# Altium schematic sheet Keyboard_V0.1.SchDoc
size A3; SheetNumber: 1; SheetTotal: 2
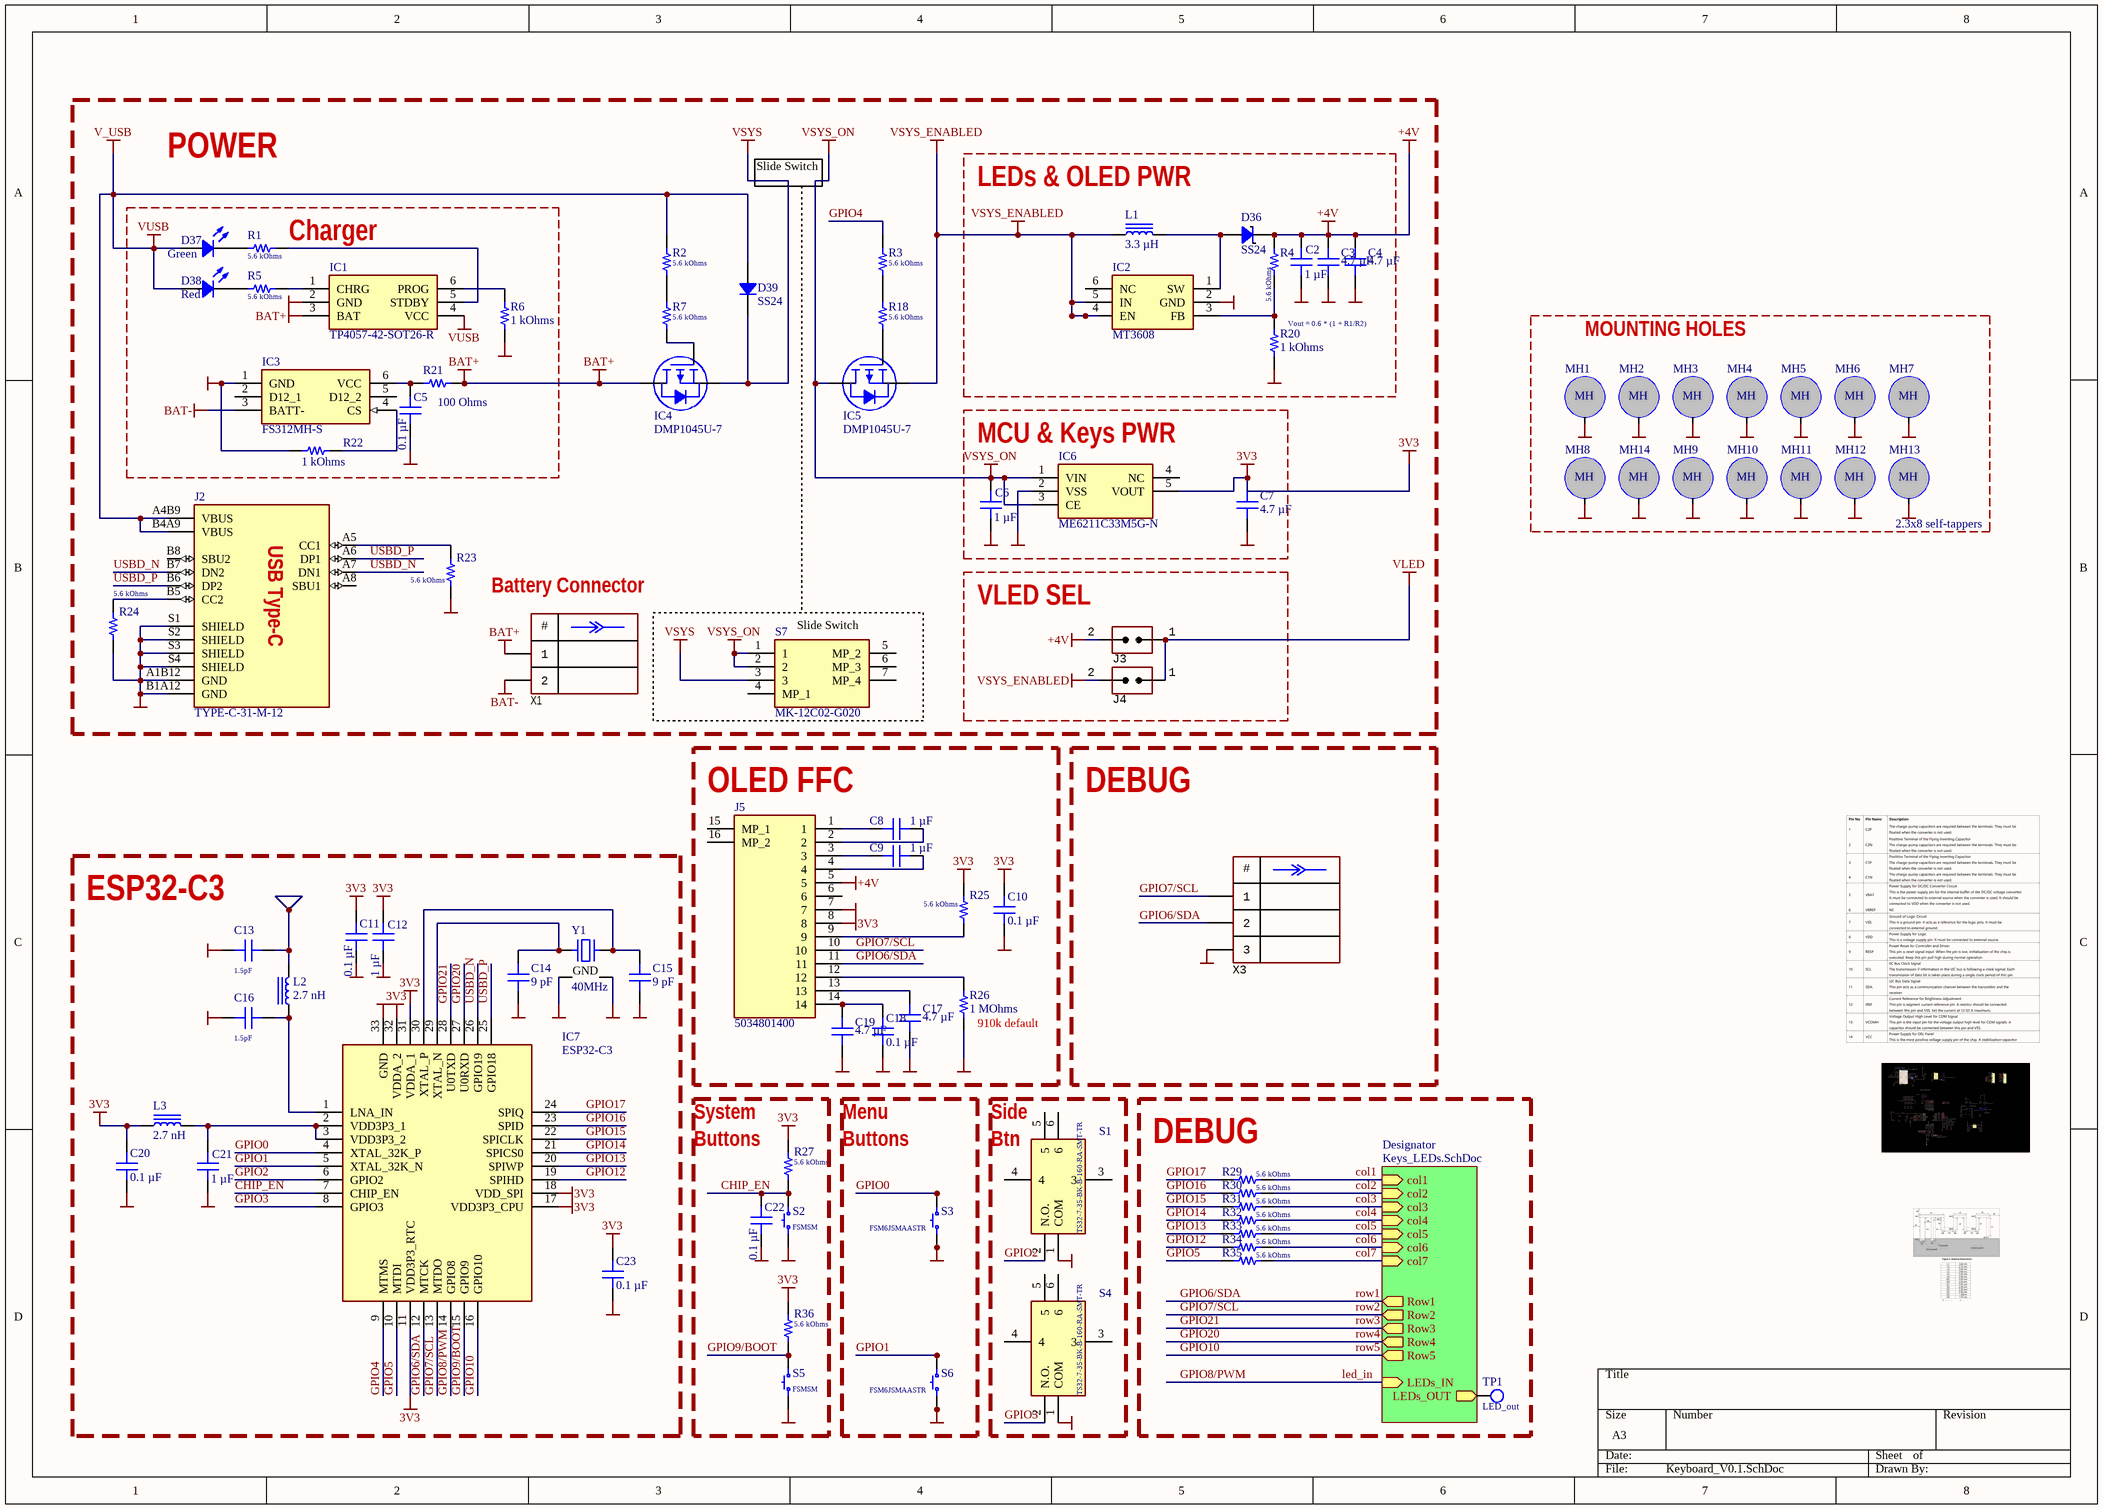
[diagram p0: Keyboard_V0.1.SchDoc]

## Parts
C2  1 µF  [CAP 0402_1005]
C3  4.7 µF  [CAP 0603_1608]
C4  4.7 µF  [CAP 0603_1608]
C5  0.1 µF  [CAP 0402_1005]
C6  1 µF  [CAP 0402_1005]
C7  4.7 µF  [CAP 0603_1608]
C8  1 µF  [CAP 0402_1005]
C9  1 µF  [CAP 0402_1005]
C10  0.1 µF  [CAP 0402_1005]
C11  0.1 µF  [CAP 0402_1005]
C12  1 µF  [CAP 0402_1005]
C13  1.5pF  [CAP 0402_1005]
C14  9 pF  [CAP 0402_1005]
C15  9 pF  [CAP 0402_1005]
C16  1.5pF  [CAP 0402_1005]
C17  4.7 µF  [CAP 0603_1608]
C18  0.1 µF  [CAP 0402_1005]
C19  4.7 µF  [CAP 0603_1608]
C20  0.1 µF  [CAP 0402_1005]
C21  1 µF  [CAP 0402_1005]
C22  0.1 µF  [CAP 0402_1005]
C23  0.1 µF  [CAP 0402_1005]
D36  SS24  [DO214AA SMB]
D37  Green  [LED 0603_1608 GREEN]
D38  Red  [LED 0603_1608 RED]
D39  SS24  [DO214AA SMB]
IC1  TP4057-42-SOT26-R  [SOT95P280X125-6N]
IC2  MT3608  [SOT95P280X145-6N]
IC3  FS312MH-S  [SOT95P280X145-6N]
IC4  DMP1045U-7  [DIODES SOT-23-3]
IC5  DMP1045U-7  [DIODES SOT-23-3]
IC6  ME6211C33M5G-N  [SOT95P270X145-5N]
IC7  ESP32-C3  [QFN50P500X500X90-33N-D]
J2  TYPE-C-31-M-12  [HRO_TYPE-C-31-M-12]
J3  (no value)  [CON: JUMPER x1]
J4  (no value)  [CON: JUMPER x1]
J5  5034801400  [5034801400]
L1  3.3 µH  [BOURNS SRR6028]
L2  2.7 nH  [Murata LQG15 0402]
L3  2.7 nH  [Murata LQG15 0402]
MH1  MountingHole  [Hole_2.5mm]  (value not drawn)
MH2  MountingHole  [Hole_2.5mm]  (value not drawn)
MH3  MountingHole  [Hole_2.5mm]  (value not drawn)
MH4  MountingHole  [Hole_2.5mm]  (value not drawn)
MH5  MountingHole  [Hole_2.5mm]  (value not drawn)
MH6  MountingHole  [Hole_2.5mm]  (value not drawn)
MH7  MountingHole  [Hole_2.5mm]  (value not drawn)
MH8  MountingHole  [Hole_2.5mm]  (value not drawn)
MH9  MountingHole  [Hole_2.5mm]  (value not drawn)
MH10  MountingHole  [Hole_2.5mm]  (value not drawn)
MH11  MountingHole  [Hole_2.5mm]  (value not drawn)
MH12  MountingHole  [Hole_2.5mm]  (value not drawn)
MH13  MountingHole  [Hole_2.5mm]  (value not drawn)
MH14  MountingHole  [Hole_2.5mm]  (value not drawn)
R1  5.6 kOhms  [RES 0402_1005]
R2  5.6 kOhms  [RES 0402_1005]
R3  5.6 kOhms  [RES 0402_1005]
R4  5.6 kOhms  [RES 0402_1005]
R5  5.6 kOhms  [RES 0402_1005]
R6  1 kOhms  [RES 0402_1005]
R7  5.6 kOhms  [RES 0402_1005]
R18  5.6 kOhms  [RES 0402_1005]
R20  1 kOhms  [RES 0402_1005]
R21  100 Ohms  [RES 0603_1608]
R22  1 kOhms  [RES 0402_1005]
R23  5.6 kOhms  [RES 0402_1005]
R24  5.6 kOhms  [RES 0402_1005]
R25  5.6 kOhms  [RES 0402_1005]
R26  1 MOhms  [RES 0603_1608]
R27  5.6 kOhms  [RES 0402_1005]
R29  5.6 kOhms  [RES 0402_1005]
R30  5.6 kOhms  [RES 0402_1005]
R31  5.6 kOhms  [RES 0402_1005]
R32  5.6 kOhms  [RES 0402_1005]
R33  5.6 kOhms  [RES 0402_1005]
R34  5.6 kOhms  [RES 0402_1005]
R35  5.6 kOhms  [RES 0402_1005]
R36  5.6 kOhms  [RES 0402_1005]
S1  TS32-7-35-BK-B-160-RA-SMT-TR  [TS32735BKB160RAHSMTTR]
S2  FSMSM  [TE FSMSMTR]
S3  FSM6JSMAASTR  [TE FSM6JSMA]
S4  TS32-7-35-BK-B-160-RA-SMT-TR  [TS32735BKB160RAHSMTTR]
S5  FSMSM  [TE FSMSMTR]
S6  FSM6JSMAASTR  [TE FSM6JSMA]
S7  MK-12C02-G020  [MK12C02G020]
TP1  LED_out  [TESTPOINT_PAD]
X1  (no value)  [CON: PLS-2]
X3  (no value)  [CON: PLS-3]
Y1  40MHz  [ABRACON ABM8G]

## Blocks framed on the sheet
POWER: D39 IC4 IC5 J2 R2 R3 R7 R18 R23 R24 X1
LEDs & OLED PWR: C2-C4 D36 IC2 L1 R4 R20
Charger: C5 D37 D38 IC1 IC3 R1 R5 R6 R21 R22
MOUNTING HOLES: MH1-MH14
MCU & Keys PWR: C6 C7 IC6
VLED SEL: J3 J4
Slide Switch: S7
OLED FFC: C8-C10 C17-C19 J5 R25 R26
DEBUG: X3
ESP32-C3: C11-C16 C20 C21 C23 IC7 L2 L3 Y1
DEBUG: R29-R35 TP1

## Sub-sheets
Designator = Keys_LEDs.SchDoc: col1 (in), col4 (in), col2 (in), col7 (in), col5 (in), col3 (in), col6 (in), Row5 (out), Row1 (out), Row2 (out), Row3 (out), Row4 (out), LEDs_IN (in), LEDs_OUT (out)

## Nets
3V3: C7.2 C10.2 C11.2 C12.2 C20.2 C23.2 IC6.5(VOUT) IC7.11(VDD3P3_RTC) IC7.17(VDD3P3_CPU) IC7.18(VDD_SPI) IC7.31(VDDA_1) IC7.32(VDDA_2) J5.8 L3.1 R25.1 R27.1 R36.1
+4V: C2.2 C3.2 C4.2 D36.2 J3.2(IN) J5.5 R4.2
BAT+: IC1.3(BAT) IC4.3(D) R21.2 X1.1
BAT-: IC3.3(BATT-) X1.2
GND: C2.1 C3.1 C4.1 C5.1 C6.1 C7.1 C10.1 C11.1 C12.1 C13.1 C14.2 C15.2 C16.1 C17.1 C18.1 C19.1 C20.1 C21.1 C22.1 C23.1 IC1.2(GND) IC2.2(GND) IC3.1(GND) IC6.2(VSS) IC7.33(GND) J2.A1B12(GND) J2.B1A12(GND) J2.S1(SHIELD) J2.S2(SHIELD) J2.S3(SHIELD) J2.S4(SHIELD) J5.7 MH1.0 MH2.0 MH3.0 MH4.0 MH5.0 MH6.0 MH7.0 MH8.0 MH9.0 MH10.0 MH11.0 MH12.0 MH13.0 MH14.0 R6.2 R20.1 R22.1 R23.2 R24.2 R26.1 S1.1(COM) S2.1 S3.1 S3.2 S4.1(COM) S5.1 S6.1 S6.2 X3.3 Y1.2(GND) Y1.4(GND)
V_USB: D37.1 D38.1 D39.1 IC1.4(VCC) J2.A4B9(VBUS) J2.B4A9(VBUS) R2.2  [also labelled VUSB]
VLED: J3.1(IN) J4.1(IN)
VSYS: D39.2 IC4.2(S) S7.3
VSYS_ENABLED: IC2.4(EN) IC2.5(IN) IC5.2(S) J4.2(IN) L1.1
VSYS_ON: C6.2 IC5.3(D) IC6.1(VIN) IC6.3(CE) S7.1 S7.2
CHIP_EN: C22.2 IC7.7(CHIP_EN) R27.2 S2.2
col1: R29.1 ; sheet Designator/col1
col2: R30.1 ; sheet Designator/col2
col3: R31.1 ; sheet Designator/col3
col4: R32.1 ; sheet Designator/col4
col5: R33.1 ; sheet Designator/col5
col6: R34.1 ; sheet Designator/col6
col7: R35.1 ; sheet Designator/col7
GPIO0: IC7.4(XTAL_32K_P) S3.3 S3.4
GPIO1: IC7.5(XTAL_32K_N) S6.3 S6.4
GPIO2: IC7.6(GPIO2) S1.2(N.O.)
GPIO3: IC7.8(GPIO3) S4.2(N.O.)
GPIO4: IC7.9(MTMS) R3.2
GPIO5: IC7.10(MTDI) R35.2
GPIO6/SDA: IC7.12(MTCK) J5.11 X3.2 ; sheet Designator/Row1  [also labelled row1]
GPIO7/SCL: IC7.13(MTDO) J5.10 X3.1 ; sheet Designator/Row2  [also labelled row2]
GPIO8/PWM: IC7.14(GPIO8) ; sheet Designator/LEDs_IN  [also labelled led_in]
GPIO9/BOOT: IC7.15(GPIO9) R36.2 S5.2
GPIO10: IC7.16(GPIO10) ; sheet Designator/Row5  [also labelled row5]
GPIO12: IC7.19(SPIHD) R34.2
GPIO13: IC7.20(SPIWP) R33.2
GPIO14: IC7.21(SPICS0) R32.2
GPIO15: IC7.22(SPICLK) R31.2
GPIO16: IC7.23(SPID) R30.2
GPIO17: IC7.24(SPIQ) R29.2
GPIO20: IC7.27(U0RXD) ; sheet Designator/Row4  [also labelled row4]
GPIO21: IC7.28(U0TXD) ; sheet Designator/Row3  [also labelled row3]
USBD_N: IC7.26(GPIO19) J2.A7(DN1) J2.B7(DN2)
USBD_P: IC7.25(GPIO18) J2.A6(DP1) J2.B6(DP2)
NetC5_2: C5.2 IC3.6(VCC) R21.1
NetC8_1: C8.1 J5.2
NetC8_2: C8.2 J5.1
NetC9_1: C9.1 J5.4
NetC9_2: C9.2 J5.3
NetC13_2: C13.2 L2.2
NetC14_1: C14.1 IC7.29(XTAL_N) Y1.1
NetC15_1: C15.1 IC7.30(XTAL_P) Y1.3
NetC16_2: C16.2 IC7.1(LNA_IN) L2.1
NetC17_2: C17.2 J5.13
NetC18_2: C18.2 C19.2 J5.14
NetC21_2: C21.2 IC7.2(VDD3P3_1) IC7.3(VDD3P3_2) L3.2
NetD36_1: D36.1 IC2.1(SW) L1.2
NetD37_2: D37.2 R1.1
NetD38_2: D38.2 R5.1
NetIC1_1: IC1.1(CHRG) R5.2
NetIC1_5: IC1.5(STDBY) R1.2
NetIC1_6: IC1.6(PROG) R6.1
NetIC2_3: IC2.3(FB) R4.1 R20.2
NetIC3_4: IC3.4(CS) R22.2
NetIC4_1: IC4.1(G) R7.1
NetIC5_1: IC5.1(G) R18.1
NetJ2_A5: J2.A5(CC1) R23.1
NetJ2_B5: J2.B5(CC2) R24.1
NetJ5_9: J5.9 R25.2
NetJ5_12: J5.12 R26.2
NetR2_1: R2.1 R7.2
NetR3_1: R3.1 R18.2
NetTP1_1: TP1.1 ; sheet Designator/LEDs_OUT

Not connected (* = marked no-connect by the designer): IC2 6(NC); IC3 2(D12_1) 5(D12_2); IC6 4(NC); J2 A8(SBU1) B8(SBU2); J5 6 15(MP_1) 16(MP_2); S1 3 4 5 6; S4 3 4 5 6; S7 4(MP_1) 5(MP_2) 6(MP_3) 7(MP_4)

## Notes on the sheet
- Slide Switch
- (near R20) Vout = 0.6 * (1 + R1/R2)
- (near J2) USB Type-C
- (near MH13) 2.3x8 self-tappers
- Battery Connector
- (near R26) 910k default
- (near R27) System
- Menu
- (near S1) Side
- (near R27) Buttons
- Buttons
- (near S1) Btn
- (in symbol MountingHole) MH
- (in symbol PLS-2) #
- (in symbol PLS-3) #

## Library data of the parts
C2 C6 C8 C9 C12 C21 = GMC04X5R105K25NT: CAP0402 X5R 1UF 10% 25V; manufacturer: Cal-Chip Electronics, Inc.; Part Number: GMC04X5R105K25NT; value: 1 µF; Applications: General Purpose; Capacitance: 1 µF; componentlink1description: Datasheet; componentlink1url: https://calchip.com/wp-content/uploads/2023/09/GMC-Series-2.pdf; componentlink2description: DigiKey Link; componentlink2url: https://www.digikey.com/en/products/detail/cal-chip-electronics-inc/GMC04X5R105K25NT/23571683; Device Package: 0402 (1005 Metric); lastupdated: 4/6/2026 7:07:11 PM; Lifecycle Status: Active; Minimum Order: 1; Mounting Type: Surface Mount, MLCC; Operating Temperature: -55°C ~ 85°C; Package / Case: 0402 (1005 Metric); packaging: TapeAndReel; partid: 62676; price: 0.01; series: GMC; Size / Dimension: 0.039" L x 0.020" W (1.00mm x 0.50mm); Supplier 1: DigiKey; Supplier Part Number 1: 4713-GMC04X5R105K25NTCT-ND; Temperature Coefficient: X5R; Thickness (Max): 0.022" (0.55mm); Tolerance: ±10%; Voltage - Rated: 25V
C3 C4 C7 C17 C19 = CL10A475KA8NQNC: CAP CER 4.7UF 25V X5R 0603; manufacturer: Samsung Electro-Mechanics; Tolerance: ±10%; Part Number: CL10A475KA8NQNC; Capacitance: 4.7 µF; Applications: General Purpose; componentlink1description: Datasheet; componentlink1url: http://www.samsungsem.com/kr/support/product-search/mlcc/CL10A475KA8NQNC.jsp; componentlink2description: DigiKey Link; componentlink2url: https://www.digikey.com/en/products/detail/samsung-electro-mechanics/CL10A475KA8NQNC/3887558; Device Package: 0603 (1608 Metric); lastupdated: 4/6/2026 7:23:52 PM; Lifecycle Status: Active; Minimum Order: 1; Mounting Type: Surface Mount, MLCC; Operating Temperature: -55°C ~ 85°C; Package / Case: 0603 (1608 Metric); packaging: TapeAndReel; partid: 2349; Part Status: Active; price: 0.06; series: CL; Size / Dimension: 0.063" L x 0.031" W (1.60mm x 0.80mm); Supplier 1: DigiKey; Supplier Part Number 1: 1276-1900-1-ND; Temperature Coefficient: X5R; Thickness (Max): 0.035" (0.90mm); value: 4.7 µF; Voltage - Rated: 25V
C5 C10 C11 C18 C20 C22 C23 = C0402C104M3PAC7867: CAP CER 0.1UF 25V X5R 0402; manufacturer: KEMET; Tolerance: ±20%; Part Number: C0402C104M3PAC7867; value: 0.1 µF; Applications: Bypass, Decoupling; Capacitance: 0.1 µF; componentlink1description: Datasheet; componentlink1url: https://api.kemet.com/component-edge/download/datasheet/C0402C104M3PAC7867.pdf; componentlink2description: DigiKey Link; componentlink2url: https://www.digikey.com/en/products/detail/kemet/C0402C104M3PAC7867/7390685; Device Package: 0402 (1005 Metric); lastupdated: 4/6/2026 7:11:09 PM; Lifecycle Status: Active; Minimum Order: 1; Mounting Type: Surface Mount, MLCC; Operating Temperature: -55°C ~ 85°C; Package / Case: 0402 (1005 Metric); packaging: TapeAndReel; partid: 2096; Part Status: Active; price: 0.01; series: SMD Comm X5R; Size / Dimension: 0.039" L x 0.020" W (1.00mm x 0.50mm); Supplier 1: DigiKey; Supplier Part Number 1: 399-15637-1-ND; Temperature Coefficient: X5R; Thickness (Max): 0.022" (0.55mm); Voltage - Rated: 25V
C13 C16 = 04025U1R5BAT2A: CAP CER 1.5PF 50V C0G/NP0 0402; manufacturer: AVX Corporation; Temperature Coefficient: C0G, NP0; Tolerance: ±0.1pF; Part Number: 04025U1R5BAT2A; Capacitance: 1.5pF; Applications: RF, Microwave, High Frequency; componentlink1description: Datasheet; componentlink1url: http://datasheets.avx.com/U-Series.pdf; componentlink2description: DigiKey Link; componentlink2url: http://digikey.com/product-detail/en/avx-corporation/04025U1R5BAT2A/478-5992-1-ND/2208917; Device Package: 0402 (1005 Metric); Features: Ultra Low ESR; lastupdated: 2/8/2022 12:26:58 PM; Lifecycle Status: Active; Minimum Order: 1; Mounting Type: Surface Mount, MLCC; Operating Temperature: -55°C ~ 125°C; Package / Case: 0402 (1005 Metric); packaging: TapeAndReel; partid: 1785; Part Status: Active; price: 0.02; series: U; Size / Dimension: 0.039" L x 0.020" W (1.00mm x 0.50mm); Supplier 1: DigiKey; Supplier Part Number 1: 478-5992-1-ND; Thickness (Max): 0.024" (0.60mm); value: 1.5pF; Voltage - Rated: 50V
C14 C15 = GCQ1555C1H9R0BB01D: CAP CER 9PF 50V C0G/NP0 0402; manufacturer: Murata Electronics; Temperature Coefficient: C0G, NP0; Tolerance: ±0.1pF; Part Number: GCQ1555C1H9R0BB01D; value: 9 pF; Applications: RF, Microwave, High Frequency, Automotive; Capacitance: 9 pF; componentlink1description: Datasheet; componentlink1url: https://search.murata.co.jp/Ceramy/image/img/A01X/G101/ENG/GCQ1555C1H9R0BB01-01.pdf; componentlink2description: DigiKey Link; componentlink2url: https://www.digikey.com/en/products/detail/murata-electronics/GCQ1555C1H9R0BB01D/7803116; Device Package: 0402 (1005 Metric); lastupdated: 4/6/2026 7:10:26 PM; Lifecycle Status: Active; Minimum Order: 1; Mounting Type: Surface Mount, MLCC; Operating Temperature: -55°C ~ 125°C; Package / Case: 0402 (1005 Metric); packaging: TapeAndReel; partid: 12256; Part Status: Active; price: 0.04; series: GCQ; Size / Dimension: 0.039" L x 0.020" W (1.00mm x 0.50mm); Supplier 1: DigiKey; Supplier Part Number 1: 490-17523-1-ND; Thickness (Max): 0.022" (0.55mm); Voltage - Rated: 50V; Ratings: AEC-Q200
D36 D39 = SS24: DIODE SCHOTTKY 40V 2A DO214AA; Manufacturer: ON Semiconductor; Current - Reverse Leakage @ Vr: 400µA @ 40V; Speed: Fast Recovery =< 500ns, > 200mA (Io); Voltage - Forward (Vf) (Max) @ If: 500mV @ 2A; Part Number: SS24; ComponentLink1Description: Datasheet; ComponentLink1URL: https://www.onsemi.com/pub/Collateral/SS29-D.pdf; ComponentLink2Description: DigiKey Link; ComponentLink2URL: http://digikey.com/product-detail/en/on-semiconductor/SS24/SS24FSCT-ND/1626273; Current - Average Rectified (Io): 2A; Diode Type: Schottky; LastUpdated: 2/8/2024 9:26:46 PM; Lifecycle Status: Active; Minimum Order: 1; Mounting Type: Surface Mount; Operating Temperature - Junction: -65°C ~ 125°C; Package / Case: DO-214AA, SMB; Packaging: TapeAndReel; PartId: 1394; Part Status: Active; Price: 0.10; Series: -; Supplier 1: DigiKey; Supplier Part Number 1: SS24FSCT-ND; Supplier Device Package: DO-214AA (SMB); Voltage - DC Reverse (Vr) (Max): 40V
D37 = 5973316507F: LED GREEN 0603 SMD; Manufacturer: Dialight; Configuration: Standard; Current - Test: 20mA; Lens Color: 1.24mm; Lens Style: Round with Domed Top; Millicandela Rating: 34mcd; Voltage - Forward (Vf) (Typ): 2V; Wavelength - Dominant: 560nm; Part Number: 5973316507F; Color: Green; ComponentLink1Description: Datasheet; ComponentLink1URL: http://www.dialightsignalsandcomponents.com/Assets/Drawings/2D_Drawings_DrawingDetailedSpec/NewDrawings/C18371C.pdf; ComponentLink2Description: DigiKey Link; ComponentLink2URL: https://www.digikey.com/en/products/detail/dialight/5973316507F/9385428; Device Package: 0603 (1608 Metric); Height (Max): 1.24mm; LastUpdated: 4/5/2026 8:36:38 PM; Lifecycle Status: Active; Minimum Order: 1; Mounting Type: Surface Mount; Package / Case: 0603 (1608 Metric); Packaging: TapeAndReel; PartId: 587; Part Status: Active; Price: 0.14; Series: 597; Size / Dimension: 1.60mm L x 0.80mm W; Supplier 1: DigiKey; Supplier Part Number 1: 350-4373-1-ND; Supplier Device Package: 0603; Value: Green
D38 = 5973005507F: LED RED 0603 SMD; Manufacturer: Dialight; Configuration: Standard; Current - Test: 20mA; Lens Color: 0.68mm; Lens Size: 1.20mm x 0.80mm; Lens Style: Rectangle with Flat Top; Millicandela Rating: 90mcd; Voltage - Forward (Vf) (Typ): 2V; Wavelength - Dominant: 630nm; Part Number: 5973005507F; Color: Red; ComponentLink1Description: Datasheet; ComponentLink1URL: http://www.dialightsignalsandcomponents.com/Assets/Drawings/2D_Drawings_DrawingDetailedSpec/NewDrawings/18369A.pdf; ComponentLink2Description: DigiKey Link; ComponentLink2URL: https://www.digikey.com/en/products/detail/dialight/5973005507F/9385429; Device Package: 0603 (1608 Metric); Height (Max): 0.68mm; LastUpdated: 4/5/2026 8:38:00 PM; Lifecycle Status: Active; Minimum Order: 1; Mounting Type: Surface Mount; Package / Case: 0603 (1608 Metric); Packaging: TapeAndReel; PartId: 378; Part Status: Active; Price: 0.09; Series: 597; Size / Dimension: 1.60mm L x 0.80mm W; Supplier 1: DigiKey; Supplier Part Number 1: 350-4374-1-ND; Supplier Device Package: 0603; Value: Red
IC1 = TP4057-42-SOT26-R: Integrated Circuit; Manufacturer_Name: Nanjing Extension Microelectronics; Datasheet Link: https://datasheet.lcsc.com/szlcsc/Nanjing-Extension-Microelectronics-TP4057_C12044.pdf; Height: 1.25mm; Manufacturer_Part_Number: TP4057-42-SOT26-R
IC2 = MT3608: Integrated Circuit; Manufacturer_Name: Aerosemi; Datasheet Link: https://www.olimex.com/Products/Breadboarding/BB-PWR-3608/resources/MT3608.pdf; Height: 1.45mm; Manufacturer_Part_Number: MT3608
IC3 = FS312MH-S: Integrated Circuit; Manufacturer_Name: Fortune Semiconductor Corporation; Datasheet Link: http://honigreporter.de/tmp/FS312MH-DS-11_EN.pdf; Height: 1.45mm; Manufacturer_Part_Number: FS312MH-S
IC4 IC5 = DMP1045U-7: MOSFET P-CH 12V 4A SOT23; Manufacturer: Diodes Incorporated; Current - Continuous Drain (Id) @ 25°C: 4A (Ta); Drive Voltage (Max Rds On,  Min Rds On): 1.8V, 4.5V; FET Type: P-Channel; Gate Charge (Qg) (Max) @ Vgs: 15.8 nC @ 4.5 V; Input Capacitance (Ciss) (Max) @ Vds: 1357 pF @ 10 V; Power Dissipation (Max): 800mW (Ta); Rds On (Max) @ Id, Vgs: 31mOhm @ 4A, 4.5V; Vgs (Max): ±8V; Vgs(th) (Max) @ Id: 1V @ 250µA; Part Number: DMP1045U-7; ComponentLink1Description: Datasheet; ComponentLink1URL: https://www.diodes.com/assets/Datasheets/DMP1045U.pdf; ComponentLink2Description: DigiKey Link; ComponentLink2URL: https://www.digikey.com/en/products/detail/diodes-incorporated/DMP1045U-7/4249936; Drain to Source Voltage (Vdss): 12 V; LastUpdated: 2/8/2024 9:46:13 PM; Lifecycle Status: Active; Minimum Order: 1; Mounting Type: Surface Mount; Operating Temperature: -55°C ~ 150°C (TJ); Package / Case: TO-236-3, SC-59, SOT-23-3; Packaging: TapeAndReel; Part Status: Active; Price: 0.07; Series: -; Supplier 1: DigiKey; Supplier Part Number 1: DMP1045U-7DICT-ND; Supplier Device Package: SOT-23-3; Technology: MOSFET (Metal Oxide)
IC6 = ME6211C33M5G-N: Integrated Circuit; Manufacturer_Name: Microne; Datasheet Link: https://datasheet.lcsc.com/szlcsc/1811131510_MICRONE-Nanjing-Micro-One-Elec-ME6211C33M5G-N_C82942.pdf; Height: 1.45mm; Manufacturer_Part_Number: ME6211C33M5G-N
IC7 = ESP32-C3: Integrated Circuit; Manufacturer_Name: Espressif Systems; Datasheet Link: https://www.espressif.com/sites/default/files/documentation/esp32-c3_datasheet_en.pdf; Height: 0.9mm; Manufacturer_Part_Number: ESP32-C3; Mouser Part Number: 356-ESP32-C3; Mouser Price/Stock: https://www.mouser.co.uk/ProductDetail/Espressif-Systems/ESP32-C3?qs=iLbezkQI%252BsiMXe7tMG%252Bo%2FA%3D%3D
J2 = TYPE-C-31-M-12: USB Connectors 24 Receptacle 1 8.94*7.3mm RoHS; MF: {'manufacturer': u'HRO Electronics Co., Ltd.'}; Package: None; Price: None; Value: *; MP: TYPE-C-31-M-12; Availability: Unavailable
J3 J4 = Jumper_single: CommentText: "Перемычка"
J5 = 5034801400: Connector; Manufacturer_Name: Molex; Datasheet Link: https://www.molex.com/content/dam/molex/molex-dot-com/products/automated/en-us/salesdrawingpdf/503/503480/5034801400_sd.pdf?inline; Height: 2.07mm; Manufacturer_Part_Number: 5034801400; Arrow Part Number: 5034801400; Arrow Price/Stock: https://www.arrow.com/en/products/503480-1400/molex?utm_currency=USD&region=nac
L1 = SRR6028-3R3Y: FIXED IND 3.3UH 2.5A 28 MOHM SMD; Manufacturer: Bourns Inc.; Current - Saturation: 2.6A; DC Resistance (DCR): 28mOhm Max; Frequency - Self Resonant: 45MHz; Inductance Frequency - Test: 100 kHz; Material - Core: Ferrite; Q @ Freq: 10 @ 7.96MHz; Shielding: Shielded; Tolerance: ±30%; Type: Drum Core, Wirewound; Part Number: SRR6028-3R3Y; ComponentLink1Description: Datasheet; ComponentLink1URL: https://www.bourns.com/docs/Product-Datasheets/SRR6028.pdf; ComponentLink2Description: DigiKey Link; ComponentLink2URL: https://www.digikey.com/en/products/detail/bourns-inc/SRR6028-3R3Y/1970369; Current Rating (Amps): 2.5 A; Device Package: Nonstandard; Height - Seated (Max): 0.118" (3.00mm); Inductance: 3.3 µH; LastUpdated: 2/8/2024 9:34:55 PM; Lifecycle Status: Active; Minimum Order: 1; Mounting Type: Surface Mount; Operating Temperature: -40°C ~ 125°C; Package / Case: Nonstandard; Packaging: TapeAndReel; PartId: 57; Part Status: Active; Price: 0.31; Series: SRR6028; Size / Dimension: 0.268" L x 0.268" W (6.80mm x 6.80mm); Supplier 1: DigiKey; Supplier Part Number 1: 118-SRR6028-3R3YCT-ND; Value: 3.3 µH
L2 L3 = LQG15HN2N7S02D: FIXED IND 2.7NH 800MA 0.1OHM SMD; Manufacturer: Murata Electronics; DC Resistance (DCR): 100mOhm Max; Frequency - Self Resonant: 6GHz; Inductance Frequency - Test: 100 MHz; Material - Core: Air; Q @ Freq: 8 @ 100MHz; Shielding: Unshielded; Tolerance: ±0.3nH; Type: Multilayer; Part Number: LQG15HN2N7S02D; ComponentLink1Description: Datasheet; ComponentLink1URL: https://search.murata.co.jp/Ceramy/image/img/P02/JELF243B-0009.pdf; ComponentLink2Description: DigiKey Link; ComponentLink2URL: https://www.digikey.com/en/products/detail/murata-electronics/LQG15HN2N7S02D/584287; Current Rating (Amps): 800 mA; Device Package: 0402 (1005 Metric); Height - Seated (Max): 0.022" (0.55mm); Inductance: 2.7 nH; LastUpdated: 4/5/2026 9:08:15 PM; Lifecycle Status: Active; Minimum Order: 1; Mounting Type: Surface Mount; Operating Temperature: -55°C ~ 125°C; Package / Case: 0402 (1005 Metric); Packaging: TapeAndReel; PartId: 2923; Part Status: Active; Price: 0.01; Series: LQG15; Size / Dimension: 0.039" L x 0.020" W (1.00mm x 0.50mm); Supplier 1: DigiKey; Supplier Part Number 1: 490-1078-1-ND; Supplier Device Package: 0402 (1005 Metric); Value: 2.7 nH
R1-R5 R7 R18 R23-R25 R27 R29-R36 = CR0402-FX-5601GLF: RES SMD 5.6K OHM 1% 1/16W 0402; Manufacturer: Bourns Inc.; Power (Watts): 0.063W, 1/16W; Temperature Coefficient: ±100ppm/°C; Part Number: CR0402-FX-5601GLF; Value: 5.6 kOhms; ComponentLink1Description: Datasheet; ComponentLink1URL: https://www.bourns.com/docs/Product-Datasheets/CR0402.pdf; ComponentLink2Description: DigiKey Link; ComponentLink2URL: https://www.digikey.com/en/products/detail/bourns-inc/CR0402-FX-5601GLF/3783426; Composition: Thick Film; Device Package: 0402 (1005 Metric); Height - Seated (Max): 0.016" (0.40mm); LastUpdated: 2/9/2024 8:30:06 PM; Lifecycle Status: Active; Minimum Order: 1; Number of Terminations: 2; Operating Temperature: -55°C ~ 155°C; Package / Case: 0402 (1005 Metric); Packaging: CutTape; PartId: 6632; Price: 0.01; Resistance: 5.6 kOhms; Series: CR0402; Size / Dimension: 0.039" L x 0.020" W (1.00mm x 0.50mm); Supplier 1: DigiKey; Supplier Part Number 1: CR0402-FX-5601GLFCT-ND; Supplier Device Package: 0402; Tolerance: ±1%; Part Status: Active
R6 R20 R22 = CR0402-FX-1001GLF: RES SMD 1K OHM 1% 1/16W 0402; Manufacturer: Bourns Inc.; Power (Watts): 0.063W, 1/16W; Temperature Coefficient: ±100ppm/°C; Part Number: CR0402-FX-1001GLF; Value: 1 kOhms; ComponentLink1Description: Datasheet; ComponentLink1URL: https://www.bourns.com/docs/Product-Datasheets/CR0402.pdf; ComponentLink2Description: DigiKey Link; ComponentLink2URL: https://www.digikey.com/en/products/detail/bourns-inc/CR0402-FX-1001GLF/3593181; Composition: Thick Film; Device Package: 0402 (1005 Metric); Height - Seated (Max): 0.016" (0.40mm); LastUpdated: 2/9/2024 8:30:06 PM; Lifecycle Status: Active; Minimum Order: 1; Number of Terminations: 2; Operating Temperature: -55°C ~ 155°C; Package / Case: 0402 (1005 Metric); Packaging: CutTape; PartId: 6619; Part Status: Active; Price: 0.01; Resistance: 1 kOhms; Series: CR0402; Size / Dimension: 0.039" L x 0.020" W (1.00mm x 0.50mm); Supplier 1: DigiKey; Supplier Part Number 1: CR0402-FX-1001GLFCT-ND; Supplier Device Package: 0402; Tolerance: ±1%
R21 = AC0603FR-07100RL: RES SMD 100 OHM 1% 1/10W 0603; Manufacturer: Yageo; Power (Watts): 0.1W, 1/10W; Temperature Coefficient: ±100ppm/°C; Part Number: AC0603FR-07100RL; Value: 100 Ohms; ComponentLink1Description: Datasheet; ComponentLink1URL: https://www.yageo.com/upload/media/product/productsearch/datasheet/rchip/PYu-AC_51_RoHS_L_7.pdf; ComponentLink2Description: DigiKey Link; ComponentLink2URL: https://www.digikey.com/en/products/detail/yageo/AC0603FR-07100RL/5895735; Composition: Thick Film; Device Package: 0603 (1608 Metric); Features: Automotive AEC-Q200, Moisture Resistant; Height - Seated (Max): 0.022" (0.55mm); LastUpdated: 4/6/2026 7:43:49 PM; Lifecycle Status: Active; Minimum Order: 1; Number of Terminations: 2; Operating Temperature: -55°C ~ 155°C; Package / Case: 0603 (1608 Metric); Packaging: CutTape; PartId: 17348; Part Status: Active; Price: 0.01; Ratings: AEC-Q200; Resistance: 100 Ohms; Series: AC; Size / Dimension: 0.063" L x 0.031" W (1.60mm x 0.80mm); Supplier 1: DigiKey; Supplier Part Number 1: YAG3561CT-ND; Supplier Device Package: 0603; Tolerance: ±1%
R26 = ERJ-3EKF1004V: RES SMD 1M OHM 1% 1/10W 0603; Manufacturer: Panasonic Electronic Components; Power (Watts): 0.1W, 1/10W; Temperature Coefficient: ±100ppm/°C; Part Number: ERJ-3EKF1004V; Value: 1 MOhms; ComponentLink1Description: Datasheet; ComponentLink1URL: https://industrial.panasonic.com/cdbs/www-data/pdf/RDA0000/AOA0000C304.pdf; ComponentLink2Description: DigiKey Link; ComponentLink2URL: https://www.digikey.com/en/products/detail/panasonic-electronic-components/ERJ-3EKF1004V/196033; Composition: Thick Film; Device Package: 0603 (1608 Metric); Height - Seated (Max): 0.022" (0.55mm); LastUpdated: 2/9/2024 8:42:00 PM; Lifecycle Status: Active; Minimum Order: 1; Number of Terminations: 2; Operating Temperature: -55°C ~ 155°C; Package / Case: 0603 (1608 Metric); Packaging: TapeAndReel; PartId: 25691; Part Status: Active; Price: 0.01; Resistance: 1 MOhms; Series: ERJ-3EK; Size / Dimension: 0.063" L x 0.031" W (1.60mm x 0.80mm); Supplier 1: DigiKey; Supplier Part Number 1: P1.00MHCT-ND; Supplier Device Package: 0603; Tolerance: ±1%; Features: Automotive AEC-Q200; Ratings: AEC-Q200
S1 S4 = TS32-7-35-BK-B-160-RA-SMT-TR: Switch; Manufacturer_Name: Same Sky; Datasheet Link: https://www.sameskydevices.com/product/resource/ts32.pdf; Height: 3.7mm; Manufacturer_Part_Number: TS32-7-35-BK-B-160-RA-SMT-TR
S2 S5 = FSMSM: SWITCH TACTILE SPST-NO 0.05A 24V; Manufacturer: TE Connectivity ALCOSWITCH Switches; Actuator Height off PCB, Vertical: 4.57mm; Actuator Orientation: Top Actuated; Actuator Type: Standard; Contact Rating @ Voltage: 0.05A @ 24VDC; Illumination: Non-Illuminated; Operating Force: 180gf; Outline: 6.00mm x 3.50mm; Switch Function: Off-Mom; Part Number: FSMSM; Circuit: SPST-NO; ComponentLink1Description: Datasheet; ComponentLink1URL: https://www.te.com/commerce/DocumentDelivery/DDEController?Action=srchrtrv&DocNm=1437566-3&DocType=Customer+Drawing&DocLang=English; ComponentLink2Description: DigiKey Link; ComponentLink2URL: https://www.digikey.com/en/products/detail/te-connectivity-alcoswitch-switches/FSMSM/525812; LastUpdated: 4/5/2026 8:58:52 PM; Lifecycle Status: Active; Minimum Order: 1; Mounting Type: Surface Mount; Operating Temperature: -35°C ~ 85°C; Packaging: Bulk; Part Status: Active; Price: 0.17; Series: FSMSM; Supplier 1: DigiKey; Supplier Part Number 1: 450-1140-ND; Termination Style: Gull Wing
S3 S6 = FSM6JSMAASTR: SWITCH TACTILE SPST-NO 0.05A 24V; Manufacturer: TE Connectivity ALCOSWITCH Switches; Actuator Height off PCB, Vertical: 7.00mm; Actuator Orientation: Top Actuated; Actuator Type: Standard; Contact Rating @ Voltage: 0.05A @ 24VDC; Illumination: Non-Illuminated; Operating Force: 260gf; Outline: 6.00mm x 6.00mm; Switch Function: Off-Mom; Part Number: FSM6JSMAASTR; Circuit: SPST-NO; ComponentLink1Description: Datasheet; ComponentLink1URL: https://www.te.com/commerce/DocumentDelivery/DDEController?Action=srchrtrv&DocNm=1308111-1_SWITCHES_CORE_PROGRAM_CATALOG&DocType=CS&DocLang=English; ComponentLink2Description: DigiKey Link; ComponentLink2URL: https://www.digikey.com/en/products/detail/te-connectivity-alcoswitch-switches/FSM6JSMAASTR/5343804; LastUpdated: 4/5/2026 8:58:52 PM; Lifecycle Status: Active; Minimum Order: 1; Mounting Type: Surface Mount; Operating Temperature: -40°C ~ 105°C; Packaging: TapeAndReel; Part Status: Active; Price: 0.30; Series: FSMJSMA; Supplier 1: DigiKey; Supplier Part Number 1: 450-2138-1-ND; Termination Style: Gull Wing
S7 = MK-12C02-G020: Switch; Manufacturer_Name: G-Switch Electronic; Datasheet Link: https://www.lcsc.com/datasheet/C963206.pdf?spm=wm.sxq.inf.ggs&lcsc_vid=FFIKVgZXQgRXBVJUQ1FeUF1UR1ENBFFQQgNcUgZWTlUxVlNRTlFeU11SRlBbUDsOAxUeFF5JWBYZEEoBGA4JCwFIFA4DSA%3D%3D; Height: 1.45mm; Manufacturer_Part_Number: MK-12C02-G020
TP1 = TestPoint
X1 = PLS-2: Manufacturer: Connfly; ValueManufacturerPartNumber: Connector, 2pin, 2.54mm, 500VAC, 3A; TypeConnector: Connector; VoltageMax: 500VAC; Pitch: 2.54mm; CurrentMax: 3A; Multichannel: 2pin; CommentText: "Разъем"; HelpURL: https://www.chipdip.ru/product/pls-2; PartNumber: PLS-2
X3 = PLS-3: Manufacturer: Connfly; ValueManufacturerPartNumber: Connector, 3pin, 2.54mm, 500VAC, 3A; TypeConnector: Connector; VoltageMax: 500VAC; Pitch: 2.54mm; CurrentMax: 3A; Multichannel: 3pin; CommentText: "Разъем"; HelpURL: https://www.chipdip.ru/product/pls-3; PartNumber: PLS-3
Y1 = ABM8G-40.000MHZ-4Y-T3: CRYSTAL 40.0000MHZ 10PF SMD; Manufacturer: Abracon LLC; ESR (Equivalent Series Resistance): 50 Ohms; Frequency Stability: ±30ppm; Operating Mode: Fundamental; Part Number: ABM8G-40.000MHZ-4Y-T3; ComponentLink1Description: Datasheet; ComponentLink1URL: https://abracon.com/Resonators/ABM8G.pdf; ComponentLink2Description: DigiKey Link; ComponentLink2URL: http://digikey.com/product-detail/en/abracon-llc/ABM8G-40.000MHZ-4Y-T3/535-10921-1-ND/2624254; Device Package: 4-SMD, No Lead; Frequency: 40MHz; Frequency Tolerance: ±30ppm; Height - Seated (Max): 0.039" (1.00mm); LastUpdated: 3/19/2020 10:36:25 PM; Lifecycle Status: Active; Load Capacitance: 10pF; Minimum Order: 1; Mounting Type: Surface Mount; Operating Temperature: -10°C ~ 60°C; Package / Case: 4-SMD, No Lead; Packaging: TapeAndReel; PartId: 336; Part Status: Active; Price: 0.39; Series: ABM8G; Size / Dimension: 0.126" L x 0.098" W (3.20mm x 2.50mm); Supplier 1: DigiKey; Supplier Part Number 1: 535-10921-1-ND; Type: MHz Crystal; Value: 40MHz